# Altium schematic sheet Battery_Input_and_Protection.SchDoc
size 431 x 279 mm; SheetNumber: 1; SheetTotal: 5
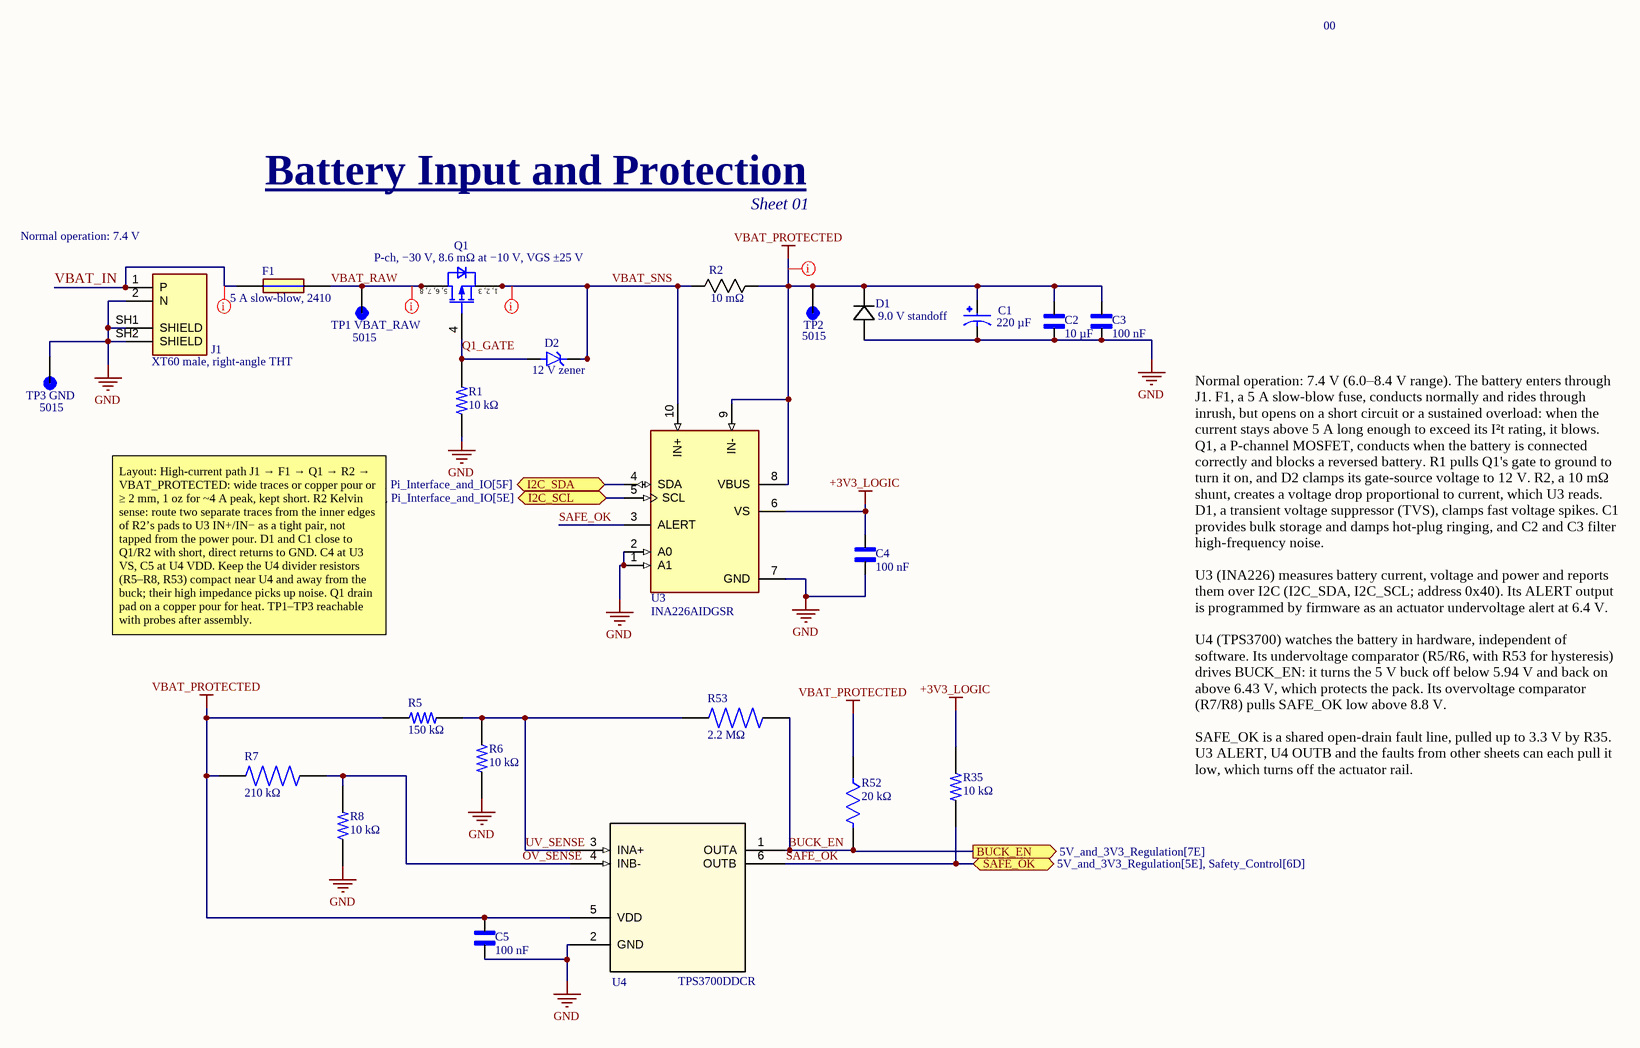
[diagram p0: Battery_Input_and_Protection.SchDoc]

## Parts
C1  220 µF  [CAP_EEEFK1E221GV]
C2  10 µF  [CAPC3216X180N]
C3  100 nF  [CAPC1608X90N]
C4  100 nF  [CAPC1608X90N]
C5  100 nF  [CAPC1608X90N]
D1  9.0 V standoff  [SMBJSeries_LTF]
D2  12 V zener  [DIO_BZT52C12-7-F]
F1  5 A slow-blow, 2410  [FUSC6127X294N]
J1  XT60 male, right-angle THT  [AMASS_XT60PW-M]
Q1  P-ch, −30 V, 8.6 mΩ at −10 V, VGS ±25 V  [INF-PG-TSDSON-8-2-V]
R1  10 kΩ  [RESC1607X60N]
R2  10 mΩ  [RES_2512_WSL]
R5  150 kΩ  [RESC1607X60N]
R6  10 kΩ  [RESC1607X60N]
R7  210 kΩ  [RESC1608X55N]
R8  10 kΩ  [RESC1607X60N]
R35  10 kΩ  [RESC1607X60N]
R52  20 kΩ  [FP-RC0603-0_55-IPC_C]
R53  2.2 MΩ  [RESC1608X55N]
TP1_VBAT_RAW  5015  [KEYSTONE_5015]
TP2  5015  [KEYSTONE_5015]
TP3_GND  5015  [KEYSTONE_5015]
U3  INA226AIDGSR  [SOP50P490X110-10N]
U4  TPS3700DDCR  [DDC6_TEX]

## Ports
BUCK_EN (out, see 5V_and_3V3_Regulation[7E]), I2C_SCL (bidir, see Pi_Interface_and_IO[5C], Pi_Interface_and_IO[5E]), I2C_SDA (bidir, see Pi_Interface_and_IO[5C], Pi_Interface_and_IO[5F]), SAFE_OK (bidir, see 5V_and_3V3_Regulation[5E], Safety_Control[6D])

## Nets
+3V3_LOGIC: C4.1 R35.1 U3.6(VS)
GND: C1.2 C2.2 C3.2 C4.2 C5.2 D1.2 J1.2(N) J1.SH1(SHIELD) J1.SH2(SHIELD) R1.1 R6.2 R8.1 TP3_GND.TP U3.1(A1) U3.2(A0) U3.7(GND) U4.2(GND)
VBAT_PROTECTED: C1.1 C2.1 C3.1 C5.1 D1.1 R2.2 R5.1 R7.2 R52.1 TP2.TP U3.8(VBUS) U3.9(IN-) U4.5(VDD)
BUCK_EN: R52.2 R53.1 U4.1(OUTA) ; port BUCK_EN
I2C_SCL: U3.5(SCL) ; port I2C_SCL
I2C_SDA: U3.4(SDA) ; port I2C_SDA
OV_SENSE: R7.1 R8.2 U4.4(INB-)
Q1_GATE: D2.2(A) Q1.4(Gate) R1.2
SAFE_OK: R35.2 U3.3(ALERT) U4.6(OUTB) ; port SAFE_OK
UV_SENSE: R5.2 R6.1 R53.2 U4.3(INA+)
VBAT_IN: F1.1 J1.1(P)
VBAT_RAW: F1.2 Q1.5(DRAIN) Q1.6(DRAIN) Q1.7(DRAIN) Q1.8(DRAIN) TP1_VBAT_RAW.TP
VBAT_SNS: D2.1(K) Q1.1(SOURCE) Q1.2(SOURCE) Q1.3(SOURCE) R2.1 U3.10(IN+)

## Layout directives
net class POWER_HI: VBAT_IN, VBAT_PROTECTED, VBAT_RAW, VBAT_SNS

## Notes on the sheet
- 00
- Battery Input and Protection
- (near J1) Normal operation: 7.4 V
- Sheet 01
- Layout: High-current path J1 → F1 → Q1 → R2 → VBAT_PROTECTED: wide traces or copper pour or ≥ 2 mm, 1 oz for ~4 A peak, kept short. R2 Kelvin sense: route two separate traces from the inner edges of R2’s pads to U3 IN+/IN− as a tight pair, not tapped from the power pour. D1 and C1 close to Q1/R2 with short, direct returns to GND. C4 at U3 VS, C5 at U4 VDD. Keep the U4 divider resistors (R5–R8, R53) compact near U4 and away from the buck; their high impedance picks up noise. Q1 drain pad on a copper pour for heat. TP1–TP3 reachable with probes after assembly.
- Normal operation: 7.4 V (6.0–8.4 V range). The battery enters through J1. F1, a 5 A slow-blow fuse, conducts normally and rides through inrush, but opens on a short circuit or a sustained overload: when the current stays above 5 A long enough to exceed its I²t rating, it blows. Q1, a P-channel MOSFET, conducts when the battery is connected correctly and blocks a reversed battery. R1 pulls Q1's gate to ground to turn it on, and D2 clamps its gate-source voltage to 12 V. R2, a 10 mΩ shunt, creates a voltage drop proportional to current, which U3 reads. D1, a transient voltage suppressor (TVS), clamps fast voltage spikes. C1 provides bulk storage and damps hot-plug ringing, and C2 and C3 filter high-frequency noise.
  U3 (INA226) measures battery current, voltage and power and reports them over I2C (I2C_SDA, I2C_SCL; address 0x40). Its ALERT output is programmed by firmware as an actuator undervoltage alert at 6.4 V.
  U4 (TPS3700) watches the battery in hardware, independent of software. Its undervoltage comparator (R5/R6, with R53 for hysteresis) drives BUCK_EN: it turns the 5 V buck off below 5.94 V and back on above 6.43 V, which protects the pack. Its overvoltage comparator (R7/R8) pulls SAFE_OK low above 8.8 V.
  SAFE_OK is a shared open-drain fault line, pulled up to 3.3 V by R35. U3 ALERT, U4 OUTB and the faults from other sheets can each pull it low, which turns off the actuator rail.
- DWG. NO.
- REV.
- SHT.
- THIS DOCUMENT AND THE DATA DISCLOSED HEREIN OR HEREWITH IS THE PROPERTY OF ALTIUM LIMITED AND MAY BE FREELY DISTRIBUTED IN WHOLE. NO RIGHTS ARE RESERVED OR EXPRESS OR IMPLIED WARANTEE GIVEN.
- REVISION
- DESCRIPTION
- DATE
- APPROVED
- ENG:
- APPROVALS
- PROJECT
- DSN:
- CHK:
- REFERENCE DOCUMENTS
- PROJECT REVISION:
- TITLE
- DOCUMENT REVISION:
- DESIGN ITEM:
- BOM:
- FAB DWG:
- PCB DWG:
- ASSY DWG:
- SCALE:
- SIZE
- B
- CAGE CODE
- FILE NAME
- DWG NO.
- SHEET
- OF
- REV
- (in symbol BSZ086P03NS3 G) 5, 6, 7, 8; 1, 2, 3

## Library data of the parts
C1 = EEEFK1E221GV: CAP ALUM 220UF 20% 25V SMD / EEEFK1E221GV / 220 µF 25 V, 160 mΩ ESR, SMD can / https://www.digikey.it/en/products/detail/panasonic-industry/EEE-FK1E221GV/10291405 / EEEFK1E221GV 220 µF 25 V, 160 mΩ ESR, SMD can; Value: *; Package: RADIAL-2 Panasonic; Purchase-URL: https://pricing.snapeda.com/search/part/EEEFK1E221GV/?ref=eda; MF: Panasonic; Check_prices: https://www.snapeda.com/parts/EEEFK1E221GV/Panasonic/view-part/?ref=eda; Price: None; MP: EEEFK1E221GV; Availability: In Stock; SnapEDA_Link: https://www.snapeda.com/parts/EEEFK1E221GV/Panasonic/view-part/?ref=snap
C2 = GRM31CR71E106KA12L: SMD capacitor X7R(EIA) with capacitance 10uF Tol.10%. Rated voltage 25Vdc 125C / 10 µF 25 V X7R 1206 / GRM31CR71E106KA12L / https://octopart.com/part/murata/GRM31CR71E106KA12L?slid=404c199c-e740-4f3a-ac3d-8ed7f0d5c56c&ssid=37a7cfac-85e6-4eb9-ad27-42d001a336a3#CadModels; MF: Murata Electronics; SnapEDA_Link: https://www.snapeda.com/parts/GRM31CR71E106KA12L/Murata+Electronics+North+America/view-part/?ref=snap; Package: 1206 Murata; Value: *; MP: GRM31CR71E106KA12L; Check_prices: https://www.snapeda.com/parts/GRM31CR71E106KA12L/Murata+Electronics+North+America/view-part/?ref=eda
C3 = GRM188R71H104KA93D: SMD Capacitor X7R(EIA) with Capacitance: 0.10uF Tol. 10%. Rated Voltage: 50Vdc / 100 nF 50 V X7R 0603 / GRM188R71H104KA93D / https://octopart.com/part/murata/GRM188R71H104KA93D?slid=b13dff97-c438-4242-af73-a6dd7cbdd469&ssid=f8334882-7657-41cd-b7d6-fdf9f837711d#CadModels; MF: Murata; SnapEDA_Link: https://www.snapeda.com/parts/GRM188R71H104KA93D/Murata/view-part/?ref=snap; Package: 1608 Murata; Value: *; MP: GRM188R71H104KA93D; Check_prices: https://www.snapeda.com/parts/GRM188R71H104KA93D/Murata/view-part/?ref=eda
C4 = GRM188R71E104KA01D: SMD Capacitor X7R(EIA) with Capacitance: 0.10uF Tol. 10%. Rated Voltage: 25Vdc / 100 nF 25 V X7R 0603 / https://octopart.com/search?full_query=GRM188R71E104KA01D&q=GRM188R71E104KA01D&s=1; MF: Murata Electronics; SnapEDA_Link: https://www.snapeda.com/parts/GRM188R71E104KA01D/Murata+Electronics+North+America/view-part/?ref=snap; Package: 1608 Murata; Value: *; MP: GRM188R71E104KA01D; Check_prices: https://www.snapeda.com/parts/GRM188R71E104KA01D/Murata+Electronics+North+America/view-part/?ref=eda
C5 = GRM188R71E104KA01D: SMD Capacitor X7R(EIA) with Capacitance: 0.10uF Tol. 10%. Rated Voltage: 25Vdc / https://octopart.com/search?full_query=GRM188R71E104KA01D&q=GRM188R71E104KA01D&s=1; MF: Murata Electronics; SnapEDA_Link: https://www.snapeda.com/parts/GRM188R71E104KA01D/Murata+Electronics+North+America/view-part/?ref=snap; Package: 1608 Murata; Value: *; MP: GRM188R71E104KA01D; Check_prices: https://www.snapeda.com/parts/GRM188R71E104KA01D/Murata+Electronics+North+America/view-part/?ref=eda
D1 = SMBJ9.0A: SMBJ9.0A / 9.0 V standoff, SMB / https://www.digikey.ie/en/products/detail/littelfuse-inc/SMBJ9-0A/688270; Manufacturer_Name: Littelfuse Inc; Copyright: Copyright (C) 2025 Ultra Librarian. All rights reserved.; Manufacturer_Part_Number: SMBJ9.0A
D2 = BZT52C12-7-F: Zener Diode 12V 5.3% 500mW SOD123 | Diodes Inc BZT52C12-7-F / BZT52C12-7-F 12 V zener, SOD-123 / https://www.digikey.com/en/products/detail/diodes-incorporated/BZT52C12-7-F/717727; MF: Diodes Inc.; SnapEDA_Link: https://www.snapeda.com/parts/BZT52C12-7-F/Diodes+Inc./view-part/?ref=snap; Package: SOD-123 Fairchild Semiconductor; Value: *; MP: BZT52C12-7-F; Check_prices: https://www.snapeda.com/parts/BZT52C12-7-F/Diodes+Inc./view-part/?ref=eda
F1 = 0454005.MR: Surface Mount Fuses 125VAC 5A .0136ohms 454 NANO2  Small size  Wide range of current rating available (0.375A to 12A)  Wide operating temperature range  RoHS compliant and Halogen Free  UL Recognized to UL/ CSA/NMX UL 248-1 and UL/CSA/NMX UL 248-14  Conforms to DENANs Appendix 3 / https://www.littelfuse.com/assetdocs/fuse-452-and-454-datasheet?assetguid=8C87AA93-80A7-4EA8-8749-A19BA03901C2; Geometry.Height: 2.94mm; Manufacturer_Name: LITTELFUSE; Manufacturer_Part_Number: 0454005.MR; Mouser Part Number: 576-0454005.MR; Mouser Price/Stock: https://www.mouser.co.uk/ProductDetail/Littelfuse/0454005MR?qs=WtG364jHAdzqVvZG3rAI%2Fw%3D%3D; Arrow Part Number: 0454005.MR; Arrow Price/Stock: https://www.arrow.com/en/products/0454005.mr/littelfuse?region=nac; Datasheet Link: https://www.mouser.com/datasheet/2/240/media-3321648.pdf
J1 = XT60PW-M: Socket, DC supply, male, PIN: 2 / https://octopart.com/part/amass/XT60PW-M; MF: AMASS; SnapEDA_Link: https://www.snapeda.com/parts/XT60PW-M/AMASS/view-part/?ref=snap; Package: Package; Value: *; MP: XT60PW-M; Check_prices: https://www.snapeda.com/parts/XT60PW-M/AMASS/view-part/?ref=eda
Q1 = BSZ086P03NS3 G: Insulated-Gate Field-Effect Transistor (IGFET), P-Channel, Enhancement, Body Diode, Pin 1 Source, 2 Source, 3 Source, 4 Gate, 5 Drain, 6 Drain, 7 Drain, 8 Drain, 8 Pins / BSZ086P03NS3 G / https://www.digikey.com/en/products/detail/infineon-technologies/BSZ086P03NS3GATMA1/2080736; Manufacturer: Infineon Technologies; Manufacturer Order Number: BSZ086P03NS3 G; PackageReference: PG-DSO-8-902
R1 R8 = RC0603FR-0710KL: 10 kOhms Â±1% 0.1W, 1/10W Chip Resistor 0603 (1608 Metric) Moisture Resistant Thick Film / 10 kΩ 1 % 0603 / https://octopart.com/part/yageo-group/RC0603FR-0710KL?slid=54dab893-c3ad-4fe4-85ee-8bc12f36e62a&ssid=b3dacb3c-e3ba-451e-bc50-2e154119b6bd#CadModels; MF: Yageo; SnapEDA_Link: https://www.snapeda.com/parts/RC0603FR-0710KL/Yageo/view-part/?ref=snap; Package: 0603 Yageo; Value: *; MP: RC0603FR-0710KL; Check_prices: https://www.snapeda.com/parts/RC0603FR-0710KL/Yageo/view-part/?ref=eda
R2 = WSL2512R0100FEA: WSL-2512 .01 1% EA e3 / WSL2512R0100FEA 10 mΩ 1 % 1 W, 2512 / https://www.digikey.com/en/products/detail/vishay-dale/WSL2512R0100FEA/712561; Manufacturer_Name: Vishay; Copyright: Copyright (C) 2026 Ultra Librarian. All rights reserved.; Manufacturer_Part_Number: WSL2512R0100FEA
R5 = RC0603FR-07150KL: 150 kOhms Â±1% 0.1W, 1/10W Chip Resistor 0603 (1608 Metric) Moisture Resistant Thick Film / 150 kΩ 1 % 0603 / Yageo RC0603FR-07150KL / https://octopart.com/part/yageo-group/RC0603FR-07150KL?slid=7267a52b-5458-460d-b3af-5cbc9f622783&ssid=8a1663fd-86ca-479a-af6d-7d8843a17d84#CadModels; SnapEDA_Link: https://www.snapeda.com/parts/RC0603FR-07150KL/Yageo/view-part/?ref=snap; Package: 0603 Yageo; Value: *; MF: Yageo; MP: RC0603FR-07150KL; Check_prices: https://www.snapeda.com/parts/RC0603FR-07150KL/Yageo/view-part/?ref=eda
R6 R35 = RC0603FR-0710KL: 10 kOhms Â±1% 0.1W, 1/10W Chip Resistor 0603 (1608 Metric) Moisture Resistant Thick Film / 10 kΩ 1 % 0603 / Yageo RC0603FR-07150KL / https://octopart.com/search?full_query=RC0603FR-0710KL&q=RC0603FR-0710KL&s=1; SnapEDA_Link: https://www.snapeda.com/parts/RC0603FR-0710KL/Yageo/view-part/?ref=snap; Package: 0603 Yageo; Value: *; MF: Yageo; MP: RC0603FR-0710KL; Check_prices: https://www.snapeda.com/parts/RC0603FR-0710KL/Yageo/view-part/?ref=eda
R7 = RC0603FR-07210KL: 210 kOhms Â±1% 0.1W, 1/10W Chip Resistor 0603 (1608 Metric) Moisture Resistant Thick Film / RC0603FR-07210KL / 210 kΩ / 10 kΩ 1 % / RC0603FR-07210KL / https://octopart.com/part/yageo-group/RC0603FR-07210KL?slid=d7ce36d7-8a58-4921-8373-64f65502f445&ssid=0484fa2a-abbb-4bdb-98e9-479695faa21c#CadModels; MF: Yageo; SnapEDA_Link: https://www.snapeda.com/parts/RC0603FR-07210KL/Yageo/view-part/?ref=snap; Package: 1608 Yageo; Value: *; MP: RC0603FR-07210KL; Check_prices: https://www.snapeda.com/parts/RC0603FR-07210KL/Yageo/view-part/?ref=eda
R52 = CMP-2000-06932-2: RES 20K OHM 1% 1/10W 0603 / 20 kOhms Â±1% 0.1W, 1/10W Chip Resistor 0603 (1608 Metric) Moisture Resistant Thick Film / SMD-RES-20K-1%-1/10W(0603) / https://octopart.com/part/yageo-group/RC0603FR-0720KL?slid=9dd42130-19c2-4799-ac31-5afd2b72cd34&ssid=b984c5c9-64c8-4793-b112-fa8b90893e5e#CadModels; Voltage Rating: 50V; Temperature Coefficient: 100ppm/°C; Power Rating: 100mW; Resistance: 20kR; Height: 0.022inch; REACH SVHC: No SVHC; Case Code (Metric): 1608; Depth: 0.8mm; Tolerance: 1%; Min Operating Temperature: -55°C; Series: RC; RoHS Compliant: Yes; Resistor Type: Thick Film; Max Power Dissipation: 100mW; Features: Moisture Resistant; Max Operating Temperature: 155°C; Package Quantity: 1; Size Code: 0603; Packaging: Tape and Reel; Width: 0.031inch; Length: 0.063inch; Military Standard: Not; Technology: THICK FILM; Number of Terminations: 2; Termination: SMD/SMT; Construction: Rectangular; Case/Package: 0603; Number of Pins: 2; Lead Free: Lead Free; Voltage Rating (DC): 50V; Resistance Tolerance: 1%; Case Code (Imperial): 0603
R53 = RC0603FR-072M2L: Äiá»‡n trá»Ÿ mÃ ng dÃ y gáº¯n bá» máº·t, DÃ²ng RC, 2,2 Mohm, 100 mW, - 1%, 50 V, 0603 [1608 Metric] / RC0603FR-072M2L / https://octopart.com/part/yageo-group/RC0603FR-072M2L?slid=d71ab9d8-a679-4832-96ed-b1c44a9cfdb9&ssid=0251966b-910a-4a6a-9854-0248babda200#CadModels; MF: Yageo; SnapEDA_Link: https://www.snapeda.com/parts/RC0603FR-072M2L/Yageo/view-part/?ref=snap; Package: 1608 Yageo; Value: *; MP: RC0603FR-072M2L; Check_prices: https://www.snapeda.com/parts/RC0603FR-072M2L/Yageo/view-part/?ref=eda
TP1_VBAT_RAW TP2 TP3_GND = 5015: Test Point Micro Mini SMT Phos Bronze/Silver 1000pc Tape & Reel | Keystone Electronics 5015 / https://www.digikey.ca/en/products/detail/keystone-electronics/5015/278886; SnapEDA_Link: https://www.snapeda.com/parts/5015/Keystone/view-part/?ref=snap; Package: None; Value: *; MF: Keystone Electronics; MP: 5015; Check_prices: https://www.snapeda.com/parts/5015/Keystone/view-part/?ref=eda
U3 = INA226AIDGSR: 36V, 16-bit, ultra-precise i2c output current/voltage/power monitor w/alert; MF: Texas Instruments; SnapEDA_Link: https://www.snapeda.com/parts/INA226AIDGSR/Texas+Instruments/view-part/?ref=snap; Package: VSSOP-10 Texas Instruments; Value: *; MP: INA226AIDGSR; Check_prices: https://www.snapeda.com/parts/INA226AIDGSR/Texas+Instruments/view-part/?ref=eda
U4 = TPS3700DDCR: High-voltage (18-V) window voltage detector for overvoltage and undervoltage monitoring 6-SOT-23-THIN -40 to 125; Manufacturer_Name: Texas Instruments; Copyright: Copyright (C) 2026 Ultra Librarian. All rights reserved.; Manufacturer_Part_Number: TPS3700DDCR; RefDes: RefDes; Type: Type